# Altium schematic sheet MCU_Core_Power.SchDoc
size A4; DocumentNumber: 3; SheetNumber: 3; SheetTotal: 28
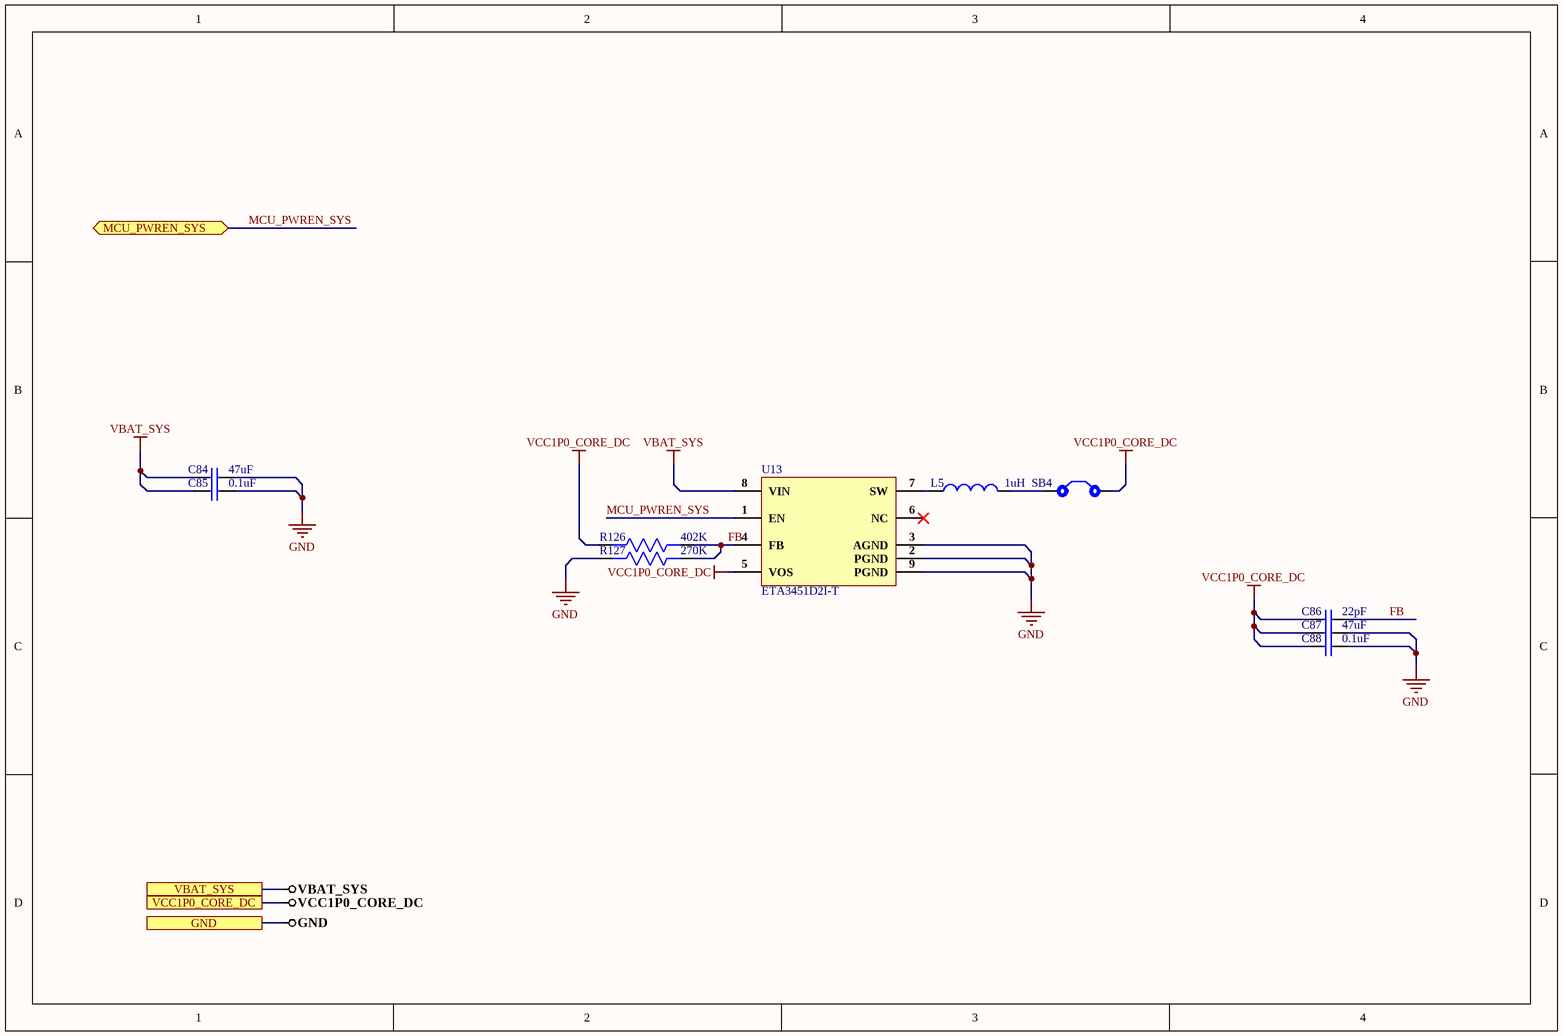
[diagram p0: MCU_Core_Power.SchDoc]

## Parts
C84  47uF  [Cap1206]
C85  0.1uF  [Cap0603]
C86  22pF  [Cap0603]
C87  47uF  [Cap1206]
C88  0.1uF  [Cap0603]
L5  1uH  [LQH32PN1R0NNCL]
R126  402K  [Res0603]
R127  270K  [Res0603]
SB4  Solder Bridge  [Solder Bridge]  (value not drawn)
U13  ETA3451D2I-T  [QFN-8]

## Ports
GND, MCU_PWREN_SYS (bidir), VBAT_SYS, VCC1P0_CORE_DC

## Nets
GND: C84.2 C85.2 C87.2 C88.2 R127.2 U13.2(PGND) U13.3(AGND) U13.9(PGND) ; port GND
VBAT_SYS: C84.1 C85.1 U13.8(VIN) ; port VBAT_SYS
VCC1P0_CORE_DC: C86.1 C87.1 C88.1 R126.2 SB4.2 U13.5(VOS) ; port VCC1P0_CORE_DC
FB: C86.2 R126.1 R127.1 U13.4(FB)
MCU_PWREN_SYS: U13.1(EN) ; port MCU_PWREN_SYS
NetL5_1: L5.1 U13.7(SW)
NetL5_2: L5.2 SB4.1

Not connected (* = marked no-connect by the designer): U13 6(NC)*

## Library data of the parts
C84 C87 = EMK316BBJ476ML-T: CAP CER 47UF 16V X5R 1206; Manufacturer: Taiyo Yuden; Tolerance: 20%; Supplier 1: Digi-Key; Manufacturer Part Number: EMK316BBJ476ML-T; Stock 1: 25339; Pricing 1: 1=0.81, 10=0.595, 100=0.408, 500=0.32304, 1000=0.27203 (USD); Mount: Surface Mount; Case/Package: 1206; Case Code (Imperial): 1206; Case Code (Metric): 3216; Min Operating Temperature: -55°C; Max Operating Temperature: 85°C; Packaging: Tape and Reel; Capacitance: 47uF; Voltage Rating: 16V; ComponentLink1URL: http://ds.yuden.co.jp/TYCOMPAS/ut/detail.do?productNo=EMK316BBJ476ML-T&fileName=EMK316BBJ476ML-T_SS&mode=specSheetDownload&src-supplier=Digi-Key; ComponentLink1Description: http://ds.yuden.co.jp/TYCOMPAS/ut/detail.do?productNo=EMK316BBJ476ML-T&fileName=EMK316BBJ476ML-T_SS&mode=specSheetDownload&src-supplier=Digi-Key; ComponentLink2URL: http://www.farnell.com/datasheets/2819853.pdf?src-supplier=Element14; ComponentLink2Description: http://www.farnell.com/datasheets/2819853.pdf?src-supplier=Element14; ComponentLink3URL: http://www.farnell.com/datasheets/2819853.pdf?src-supplier=Farnell; ComponentLink3Description: http://www.farnell.com/datasheets/2819853.pdf?src-supplier=Farnell; ComponentLink4URL: http://www.farnell.com/datasheets/2819853.pdf?src-supplier=Newark; ComponentLink4Description: http://www.farnell.com/datasheets/2819853.pdf?src-supplier=Newark; Supplier Part Number 1: 587-5425-1-ND
C85 C88 = CC0603ZRY5V9BB104: CAP CER 0.1UF 50V Y5V 0603; Manufacturer: Yageo; Capacitance: 100nF; Tolerance: 80%; Supplier 1: Digi-Key; Manufacturer Part Number: CC0603ZRY5V9BB104; Stock 1: 15000880; Pricing 1: 1=0.1, 10=0.075, 100=0.0334, 500=0.02386, 1000=0.01874 (USD); Mount: Surface Mount; Case/Package: 0603; Number of Pins: 2; Case Code (Metric): 1608; Case Code (Imperial): 0603; Min Operating Temperature: -30°C; Max Operating Temperature: 85°C; Dielectric: Y5V; Voltage Rating: 50V; Package Quantity: 1; Packaging: Tape and Reel; Voltage Rating (DC): 50V; Termination: SMD/SMT; Composition: Ceramic; Voltage: 50V; Length: 1.6mm; Height: 0.8mm; Width: 0.031inch; Thickness: 0.035inch; Depth: 0.8mm; Radiation Hardening: No; REACH SVHC: No SVHC; Lead Free: Lead Free; Halogen Free: Halogen Free; ComponentLink1URL: http://www.yageo.com/documents/recent/UPY-GPHC_Y5V_6.3V-to-50V_8.pdf?src-supplier=Digi-Key; ComponentLink1Description: http://www.yageo.com/documents/recent/UPY-GPHC_Y5V_6.3V-to-50V_8.pdf?src-supplier=Digi-Key; ComponentLink2URL: http://www.yageo.com/documents/recent/UPY-GPHC_Y5V_6.3V-to-50V_5.pdf?src-supplier=Avnet+Europe; ComponentLink2Description: http://www.yageo.com/documents/recent/UPY-GPHC_Y5V_6.3V-to-50V_5.pdf?src-supplier=Avnet+Europe; ComponentLink3URL: https://www.verical.com/server-webapp/html/getDatasheet?partID=403611&src-supplier=Verical; ComponentLink3Description: https://www.verical.com/server-webapp/html/getDatasheet?partID=403611&src-supplier=Verical; ComponentLink4URL: http://www.mouser.com/ds/2/447/Yageo_UPY-GP_NP0_16V-to-50V_9-358835.pdf?src-supplier=Mouser; ComponentLink4Description: http://www.mouser.com/ds/2/447/Yageo_UPY-GP_NP0_16V-to-50V_9-358835.pdf?src-supplier=Mouser; ComponentLink5URL: http://www.farnell.com/datasheets/1132289.pdf?src-supplier=Element14; ComponentLink5Description: http://www.farnell.com/datasheets/1132289.pdf?src-supplier=Element14; Supplier Part Number 1: 311-1343-1-ND
C86 = CC0603JRNPO9BN220: CAP CER 22PF 50V C0G/NPO 0603; Manufacturer: Yageo; Tolerance: 5%; Dielectric: C0G; Temperature Coefficient: 30ppm/°C; Insulation Resistance: 10GR; Supplier 1: Digi-Key; Manufacturer Part Number: CC0603JRNPO9BN220; Stock 1: 221639; Pricing 1: 1=0.1, 10=0.044, 100=0.0197, 500=0.0141, 1000=0.01108 (USD); Mount: Surface Mount; Case/Package: 0603; Number of Pins: 2; Case Code (Imperial): 0603; Case Code (Metric): 1608; Min Operating Temperature: -55°C; Max Operating Temperature: 125°C; Capacitance: 22pF; Voltage Rating: 50V; Voltage Rating (DC): 50V; Packaging: Tape and Reel; Package Quantity: 1; Termination: SMD/SMT; Voltage: 50V; Length: 1.6mm; Height: 0.8mm; Width: 0.031inch; Thickness: 0.035inch; Depth: 0.8mm; Radiation Hardening: No; REACH SVHC: No SVHC; Lead Free: Lead Free; ComponentLink1URL: http://www.farnell.com/datasheets/2213336.pdf?src-supplier=Element14; ComponentLink1Description: http://www.farnell.com/datasheets/2213336.pdf?src-supplier=Element14; ComponentLink2URL: http://www.yageo.com/documents/recent/UPY-GP_NP0_16V-to-50V_16.pdf?src-supplier=Digi-Key; ComponentLink2Description: http://www.yageo.com/documents/recent/UPY-GP_NP0_16V-to-50V_16.pdf?src-supplier=Digi-Key; ComponentLink3URL: http://www.farnell.com/datasheets/1443161.pdf?src-supplier=Element14; ComponentLink3Description: http://www.farnell.com/datasheets/1443161.pdf?src-supplier=Element14; ComponentLink4URL: http://www.yageo.com/documents/recent/UPY-GP_NP0_16V-to-50V_8.pdf?src-supplier=Avnet; ComponentLink4Description: http://www.yageo.com/documents/recent/UPY-GP_NP0_16V-to-50V_8.pdf?src-supplier=Avnet; ComponentLink5URL: http://www.yageo.com/documents/recent/UPY-GP_NP0_16V-to-50V_8.pdf?src-supplier=Avnet+Europe; ComponentLink5Description: http://www.yageo.com/documents/recent/UPY-GP_NP0_16V-to-50V_8.pdf?src-supplier=Avnet+Europe; Supplier Part Number 1: 311-1062-1-ND
L5 = LQH32PN1R0NNCL: FIXED IND 1UH 2.5A 43.2 MOHM SMD; Manufacturer: Murata; Core Material: Ferrite; Inductance Tolerance: 30%; Self Resonant Frequency: 100MHz; Shielding: Shielded; Saturation Current: 3A; DC Resistance (DCR): 43.2mR; Test Frequency: 1MHz; Max DC Current: 1.75A; Supplier 1: Mouser; Manufacturer Part Number: LQH32PN1R0NNCL; RoHS: Yes; Category: Fixed Inductors; Stock 1: 228; Pricing 1: 1=0.48000, 10=0.33500, 50=0.33500, 100=0.28700, 1000=0.20100, 10000=0.19400 (USD); Mount: Surface Mount; Case/Package: 1210; Case Code (Metric): 3225; Case Code (Imperial): 1210; Weight: 0.000564oz; Min Operating Temperature: -40°C; Max Operating Temperature: 85°C; Package Quantity: 2000; Packaging: Tape and Reel; Tolerance: 30%; Current Rating: 2.5A; Resistor Type: Wirewound; Inductance: 1uH; Termination: SMD/SMT; Series: LQH32PN_NC; Length: 0.126inch; Width: 2.5mm; Height: 2mm; Height - Seated (Max): 0.086inch; REACH SVHC: No SVHC; Lead Free: Lead Free; RoHS Compliant: Yes; ComponentLink1URL: https://datasheet.ciiva.com/8002/1668059-8002720.pdf?src-supplier=Element14; ComponentLink1Description: https://datasheet.ciiva.com/8002/1668059-8002720.pdf?src-supplier=Element14; ComponentLink2URL: https://datasheet.ciiva.com/29691/o05e-29691893.pdf?src-supplier=Digi-Key; ComponentLink2Description: https://datasheet.ciiva.com/29691/o05e-29691893.pdf?src-supplier=Digi-Key; Supplier Part Number 1: 81-LQH32PN1R0NNCL
R126 = RK73H1JTTD4023F: RES 402K OHM 1% 1/10W 0603; Manufacturer: KOA Speer; Resistance: 402kR; Power Rating: 100mW; Voltage Rating: 50V; Temperature Coefficient: 100ppm/°C; Supplier 1: Digi-Key; Manufacturer Part Number: RK73H1JTTD4023F; RoHS: Yes; Category: Chip SMD Resistors; Stock 1: 50000; Pricing 1: 1=0.10000, 10=0.02200, 100=0.00910, 1000=0.00408, 2500=0.00354 (USD); Case/Package: 0603; Case Code (Imperial): 0603; Case Code (Metric): 1608; Min Operating Temperature: -55°C; Max Operating Temperature: 155°C; Tolerance: 1%; Packaging: Tape and Reel; Resistor Type: Thick Film; Termination: SMD/SMT; Voltage Rating (DC): 50V; Series: RK73H; Construction: Rectangular; Length: 1.6mm; Depth: 0.8mm; Military Standard: Not; Lead Free: Lead Free; RoHS Compliant: Yes; ComponentLink1URL: https://datasheet.ciiva.com/5553/rk73h-5553241.pdf?src-supplier=Mouser; ComponentLink1Description: https://datasheet.ciiva.com/5553/rk73h-5553241.pdf?src-supplier=Mouser; Supplier Part Number 1: 2019-RK73H1JTTD4023FCT-ND
R127 = CRCW0603270KFKEAHP: RES SMD 270K OHM 1% 1/4W 0603; Manufacturer: Vishay Dale; Resistance: 270kR; Power Rating: 250mW; Temperature Coefficient: 100ppm/°C; Supplier 1: Digi-Key; Manufacturer Part Number: CRCW0603270KFKEAHP; RoHS: Yes; Category: Chip SMD Resistors; Stock 1: 1711; Pricing 1: 1=0.17000, 10=0.14800, 100=0.05790, 1000=0.02422, 2500=0.02220 (USD); Mount: Surface Mount; Case/Package: 0603; Contact Plating: Tin; Min Operating Temperature: -55°C; Max Operating Temperature: 155°C; Package Quantity: 5000; Tolerance: 1%; Packaging: Tape and Reel; Resistor Type: Thick Film; Number of Terminations: 2; Max Power Dissipation: 250mW; Termination: Wraparound; Features: Automotive AEC-Q200; Series: CRCW-HP; Length: 0.063inch; Width: 0.033inch; Height: 0.022inch; Lead Free: Lead Free; RoHS Compliant: Yes; ComponentLink1URL: https://datasheet.ciiva.com/2576/crcwhpe3-2576986.pdf?src-supplier=Digi-Key; ComponentLink1Description: https://datasheet.ciiva.com/2576/crcwhpe3-2576986.pdf?src-supplier=Digi-Key; Supplier Part Number 1: 541-CRCW0603270KFKEAHPCT-ND
SB4 = Solder Bridge: Solder Bridge ON
U13 = ETA3451D2I-T: Manufacturer: ZUCZUG; Value: Custom; Manufacturer Part No: ETA3451D2I-T; Package: QFN-8